# Altium schematic sheet RS485_Sensors_Circuit.SchDoc
size A; SheetNumber: 2; SheetTotal: 2
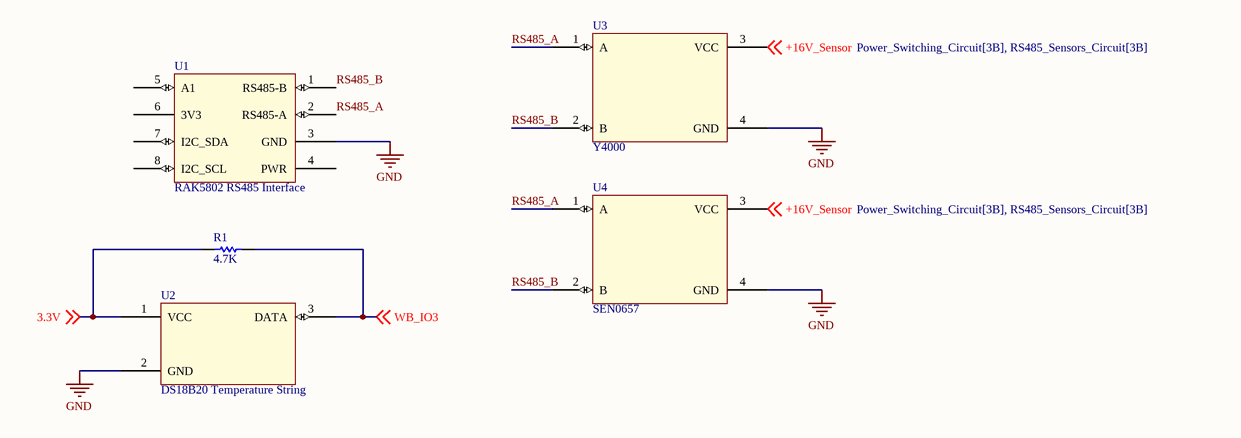
[diagram p0: RS485_Sensors_Circuit.SchDoc]

## Parts
R1  value 4.7K  (hidden comment: Resistor)
U1  RAK5802 RS485 Interface
U2  DS18B20 Temperature String
U3  Y4000
U4  SEN0657

## Nets
GND: U1.3(GND) U2.2(GND) U3.4(GND) U4.4(GND)
3.3V: R1.1 U2.1(VCC) ; off-sheet 3.3V
+16V_Sensor: U3.3(VCC) U4.3(VCC) ; off-sheet +16V_Sensor
RS485_A: U1.2(RS485-A) U3.1(A) U4.1(A)
RS485_B: U1.1(RS485-B) U3.2(B) U4.2(B)
WB_IO3: R1.2 U2.3(DATA) ; off-sheet WB_IO3

Not connected (* = marked no-connect by the designer): U1 4(PWR) 5(A1) 6(3V3) 7(I2C_SDA) 8(I2C_SCL)

## Library data of the parts
R1 = Resistor: TC1: 0; SimulationGenericComponent: True; TC2: 0
U1 = RAK5802_Connector
U2 = DS18B20